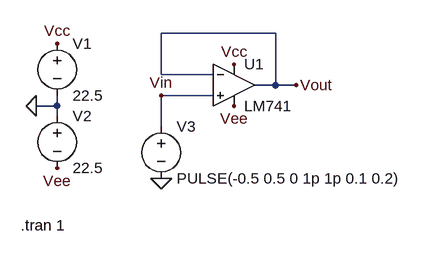
[diagram p0: schematic slewRateCiruit.asc]
slewRateCiruit.asc, the LTspice schematic file:
Version 4
SHEET 1 880 680
WIRE 208 96 32 96
WIRE 32 160 32 96
WIRE 112 160 32 160
WIRE 208 176 208 96
WIRE 208 176 176 176
WIRE 240 176 208 176
WIRE 112 192 32 192
WIRE -128 208 -128 192
WIRE -128 208 -160 208
WIRE -128 224 -128 208
WIRE 32 240 32 192
FLAG -160 208 0
FLAG -128 112 Vcc
FLAG -128 304 Vee
FLAG 144 144 Vcc
FLAG 144 208 Vee
FLAG 240 176 Vout
FLAG 32 192 Vin
FLAG 32 320 0
SYMBOL LM741 144 112 R0
SYMATTR InstName U1
SYMBOL voltage -128 96 R0
WINDOW 123 0 0 Left 0
WINDOW 39 0 0 Left 0
SYMATTR InstName V1
SYMATTR Value 22.5
SYMBOL voltage -128 208 R0
WINDOW 123 0 0 Left 0
WINDOW 39 0 0 Left 0
SYMATTR InstName V2
SYMATTR Value 22.5
SYMBOL voltage 32 224 R0
WINDOW 123 0 0 Left 0
WINDOW 39 0 0 Left 0
SYMATTR InstName V3
SYMATTR Value PULSE(-0.5 0.5 0 1p 1p 0.1 0.2)
TEXT -184 392 Left 2 !.tran 1

The netlist it stands for:
* slewRateCiruit.asc
XU1 Vin Vout Vcc Vee Vout LM741  ; pins In+ In- V+ V- OUT
V1 Vcc 0 22.5
V2 0 Vee 22.5
V3 Vin 0 PULSE(-0.5 0.5 0 1p 1p 0.1 0.2)
.tran 1
.lib LM741.lib
.backanno
.end